# EasyEDA Pro project ProPrj_国赛底层板子_2026-05-31.epro, schematic 国赛底板a
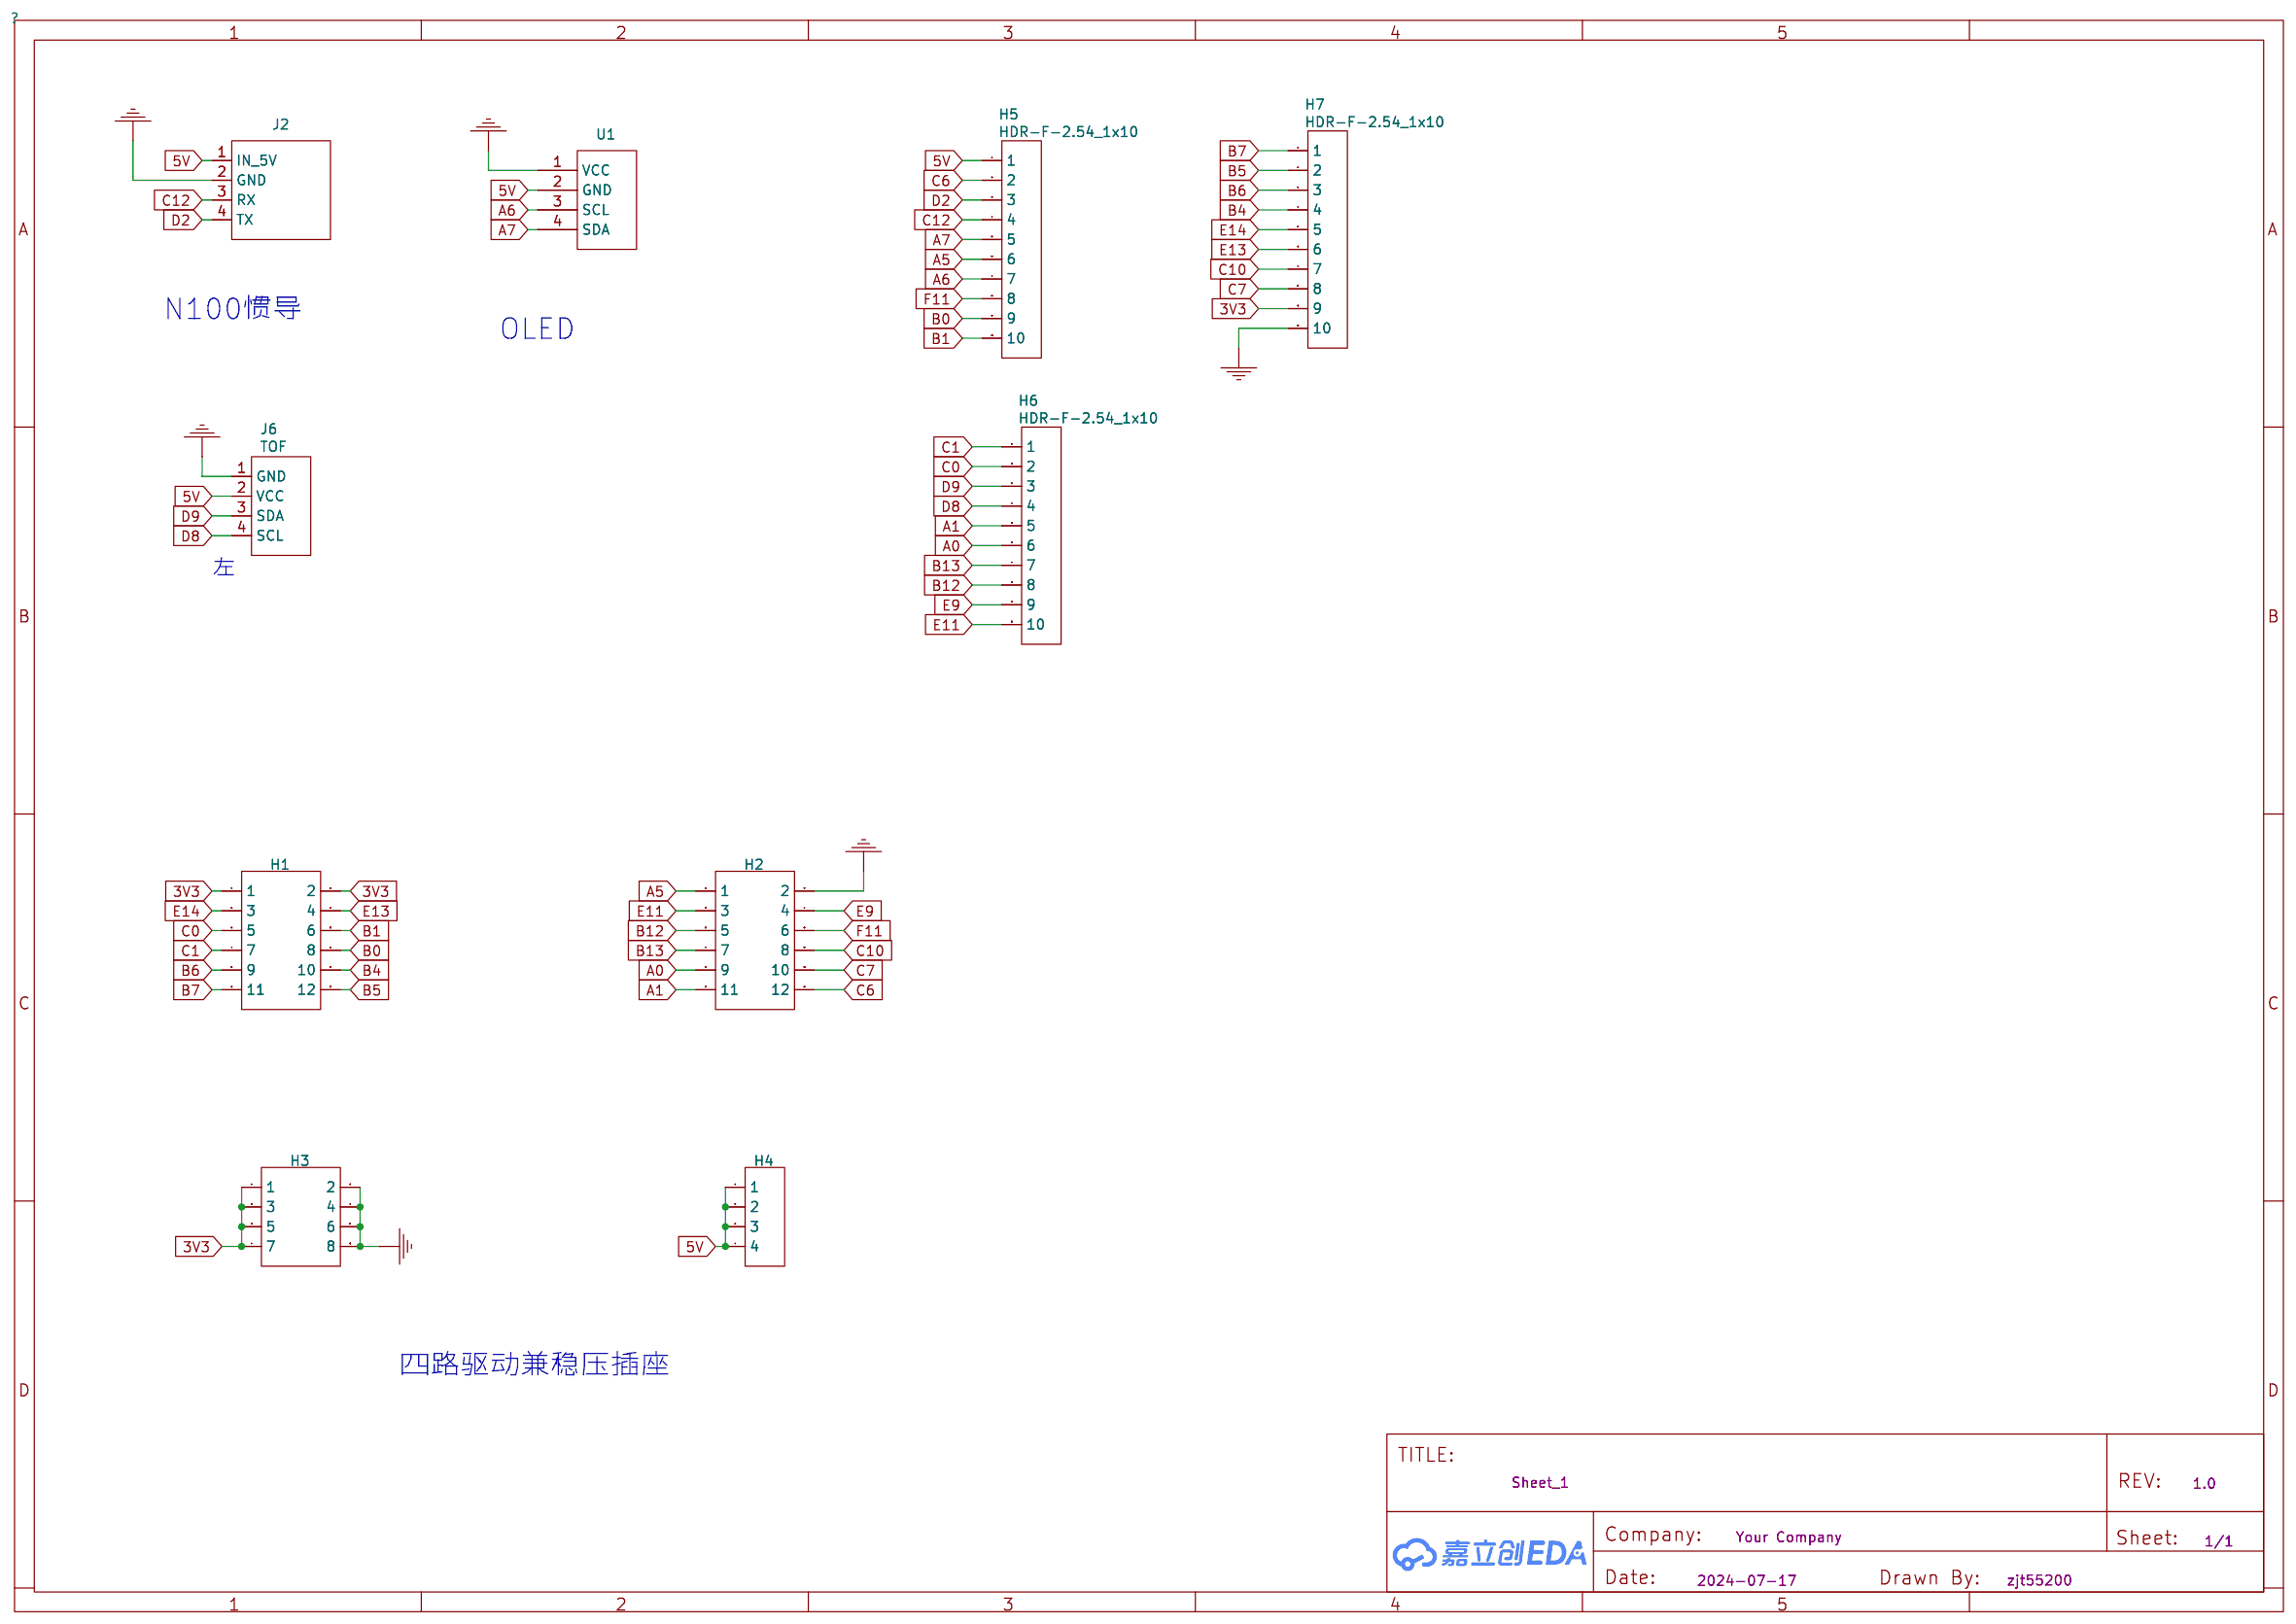
[diagram p2: schematic sheet]

## Parts
H1  HDR-F-2.54_2x6  [HDR-F-2.54_2X6]
H2  HDR-F-2.54_2x6  [HDR-F-2.54_2X6]
H3  HDR-F-2.54_2x4  [HDR-F-2.54_2X4]
H4  HDR-F-2.54_1x4  [HDR-F-2.54_1X4]
H5  HDR-F-2.54_1x10  [HDR-F-2.54_1X10]
H6  HDR-F-2.54_1x10  [HDR-F-2.54_1X10]
H7  HDR-F-2.54_1x10  [HDR-F-2.54_1X10]
J2  N100  [OLED10.96OLED]
J6  TOF  [OLED10.96OLED]
U1  OLED 0.96OLED  [OLED10.96OLED]

## Library data of the parts
H1 H2 = HDR-F-2.54_2x6: Supplier Part: C36191; Supplier: LCSC
H3 = HDR-F-2.54_2x4: Supplier Part: C239344; Supplier: LCSC
H4 = HDR-F-2.54_1x4: Supplier Part: C225501; Supplier: LCSC
H5-H7 = HDR-F-2.54_1x10: Supplier Part: C35445; Supplier: LCSC
J2 = N100
J6 = TOF
U1 = OLED 0.96OLED

## Nets
3V3: H1.1 H1.2 H3.1 H3.3 H3.5 H3.7 H7.9
5V: H4.1 H4.2 H4.3 H4.4 H5.1 J2.1(IN_5V) J6.2(VCC) U1.2(GND)
GND: H2.2 H3.2 H3.4 H3.6 H3.8 H7.10 J2.2(GND) J6.1(GND) U1.1(VCC)
A0: H2.9 H6.6
A1: H2.11 H6.5
A5: H2.1 H5.6
A6: H5.7 U1.3(SCL)
A7: H5.5 U1.4(SDA)
B0: H1.8 H5.9
B1: H1.6 H5.10
B4: H1.10 H7.4
B5: H1.12 H7.2
B6: H1.9 H7.3
B7: H1.11 H7.1
B12: H2.5 H6.8
B13: H2.7 H6.7
C0: H1.5 H6.2
C1: H1.7 H6.1
C6: H2.12 H5.2
C7: H2.10 H7.8
C10: H2.8 H7.7
C12: H5.4 J2.3(RX)
D2: H5.3 J2.4(TX)
D8: H6.4 J6.4(SCL)
D9: H6.3 J6.3(SDA)
E9: H2.4 H6.9
E11: H2.3 H6.10
E13: H1.4 H7.6
E14: H1.3 H7.5
F11: H2.6 H5.8

## Notes on the sheet
- N100惯导
- OLED
- 左
- 四路驱动兼稳压插座
